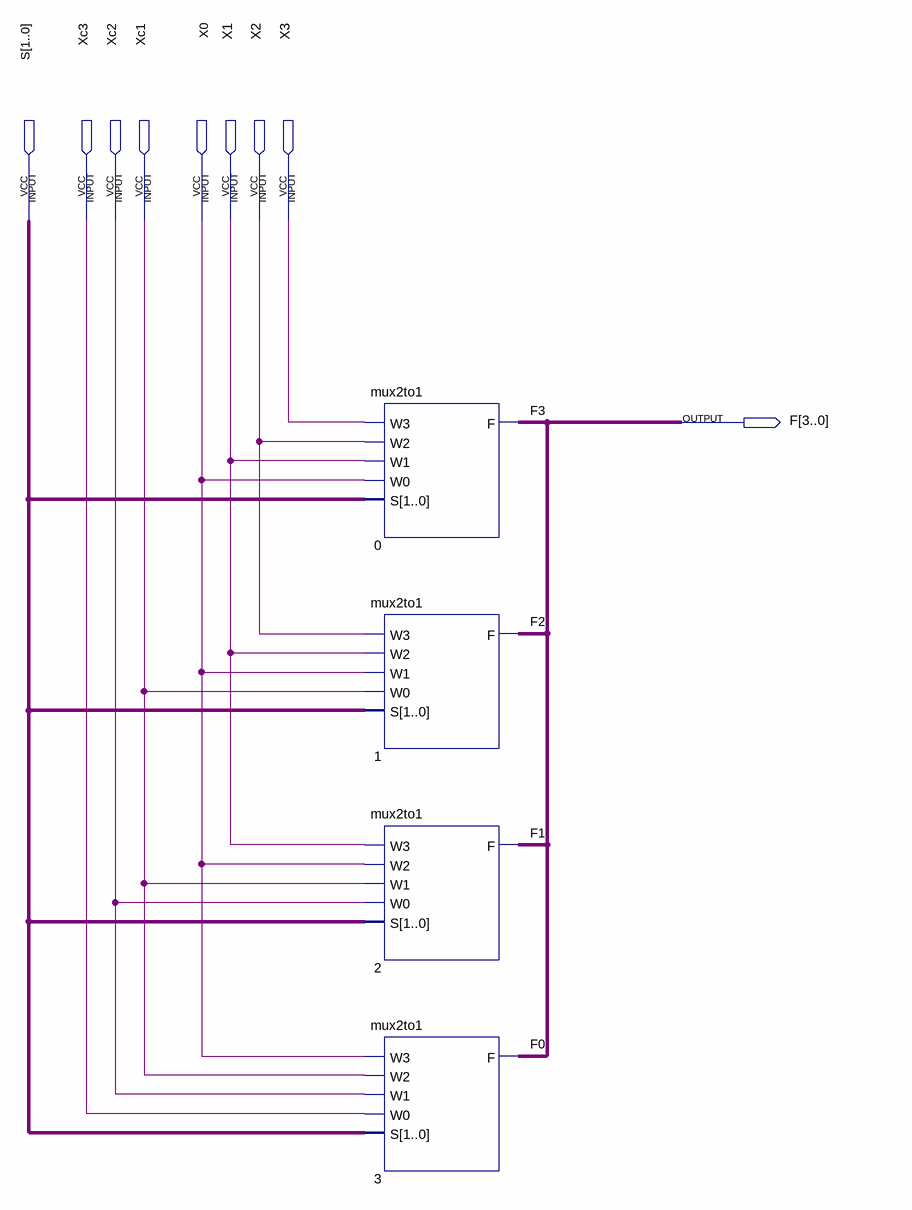
[diagram p0: schematic sheet]
// Quartus schematic shifter.bdf as structural Verilog: 4 symbols, 9 pins
module shifter (
  input  [1:0] S,
  input  Xc3,
  input  Xc2,
  input  Xc1,
  input  X0,
  input  X1,
  input  X2,
  input  X3,
  output [3:0] F
);

  mux2to1 u_0 (.W3(X3), .W2(X2), .W1(X1), .W0(X0), .S(S), .F(F[3]));
  mux2to1 u_1 (.W3(X2), .W2(X1), .W1(X0), .W0(Xc1), .S(S), .F(F[2]));
  mux2to1 u_2 (.W3(X1), .W2(X0), .W1(Xc1), .W0(Xc2), .S(S), .F(F[1]));
  mux2to1 u_3 (.W3(X0), .W2(Xc1), .W1(Xc2), .W0(Xc3), .S(S), .F(F[0]));
endmodule
